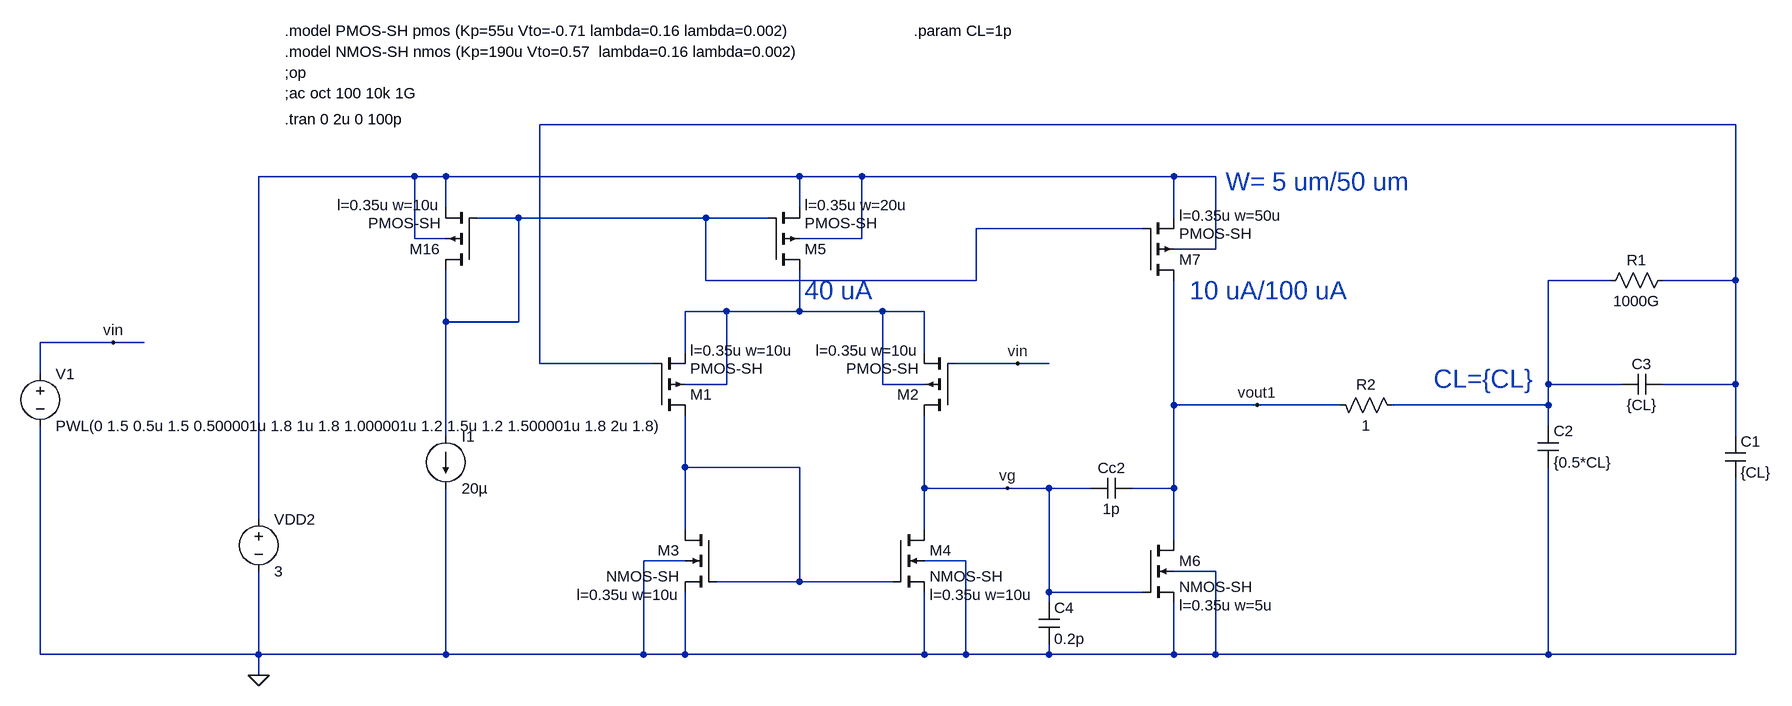
[diagram p0: schematic 5_pmos_opamp_miller-SR.asc]
5_pmos_opamp_miller-SR.asc, the LTspice schematic file:
Version 4
SHEET 1 2008 1124
WIRE 1936 -624 96 -624
WIRE -96 -544 -336 -544
WIRE -48 -544 -96 -544
WIRE 496 -544 -48 -544
WIRE 592 -544 496 -544
WIRE 1072 -544 592 -544
WIRE 1136 -544 1072 -544
WIRE -48 -496 -48 -544
WIRE 496 -496 496 -544
WIRE 64 -480 0 -480
WIRE 352 -480 64 -480
WIRE 448 -480 352 -480
WIRE 1072 -480 1072 -544
WIRE 1024 -464 768 -464
WIRE -96 -448 -96 -544
WIRE -48 -448 -96 -448
WIRE 592 -448 592 -544
WIRE 592 -448 496 -448
WIRE 1136 -432 1136 -544
WIRE 1136 -432 1072 -432
WIRE 352 -384 352 -480
WIRE 768 -384 768 -464
WIRE 768 -384 352 -384
WIRE 1744 -384 1648 -384
WIRE 1936 -384 1936 -624
WIRE 1936 -384 1824 -384
WIRE 384 -336 320 -336
WIRE 496 -336 496 -400
WIRE 496 -336 384 -336
WIRE 624 -336 496 -336
WIRE 688 -336 624 -336
WIRE -48 -320 -48 -400
WIRE 64 -320 64 -480
WIRE 64 -320 -48 -320
WIRE -560 -288 -672 -288
WIRE -512 -288 -560 -288
WIRE 320 -272 320 -336
WIRE 688 -272 688 -336
WIRE 96 -256 96 -624
WIRE 272 -256 96 -256
WIRE 832 -256 736 -256
WIRE 880 -256 832 -256
WIRE -672 -240 -672 -288
WIRE 384 -224 384 -336
WIRE 384 -224 320 -224
WIRE 624 -224 624 -336
WIRE 688 -224 624 -224
WIRE 1648 -224 1648 -384
WIRE 1760 -224 1648 -224
WIRE 1936 -224 1936 -384
WIRE 1936 -224 1824 -224
WIRE 1072 -192 1072 -384
WIRE 1200 -192 1072 -192
WIRE 1328 -192 1200 -192
WIRE 1648 -192 1648 -224
WIRE 1648 -192 1408 -192
WIRE 1648 -160 1648 -192
WIRE -48 -144 -48 -320
WIRE 1936 -144 1936 -224
WIRE 320 -96 320 -176
WIRE 496 -96 320 -96
WIRE 688 -64 688 -176
WIRE 816 -64 688 -64
WIRE 880 -64 816 -64
WIRE 944 -64 880 -64
WIRE 1072 -64 1072 -192
WIRE 1072 -64 1008 -64
WIRE -336 -16 -336 -544
WIRE 320 0 320 -96
WIRE 688 0 688 -64
WIRE 1072 16 1072 -64
WIRE 320 48 256 48
WIRE 752 48 688 48
WIRE 1136 64 1072 64
WIRE 496 80 496 -96
WIRE 496 80 368 80
WIRE 640 80 496 80
WIRE 880 96 880 -64
WIRE 1024 96 880 96
WIRE 880 112 880 96
WIRE -672 192 -672 -160
WIRE -336 192 -336 64
WIRE -336 192 -672 192
WIRE -48 192 -48 -64
WIRE -48 192 -336 192
WIRE 256 192 256 48
WIRE 256 192 -48 192
WIRE 320 192 320 96
WIRE 320 192 256 192
WIRE 688 192 688 96
WIRE 688 192 320 192
WIRE 752 192 752 48
WIRE 752 192 688 192
WIRE 880 192 880 176
WIRE 880 192 752 192
WIRE 1072 192 1072 112
WIRE 1072 192 880 192
WIRE 1136 192 1136 64
WIRE 1136 192 1072 192
WIRE 1648 192 1648 -96
WIRE 1648 192 1136 192
WIRE 1936 192 1936 -80
WIRE 1936 192 1648 192
WIRE -336 224 -336 192
FLAG -336 224 0
FLAG 1200 -192 vout1
FLAG -560 -288 vin
FLAG 832 -256 vin
FLAG 816 -64 vg
SYMBOL pmos4 272 -176 M180
WINDOW 123 56 100 Left 2
SYMATTR Value2 l=0.35u w=10u
SYMATTR InstName M1
SYMATTR Value PMOS-SH
SYMBOL pmos4 736 -176 R180
WINDOW 123 56 100 Left 2
SYMATTR Value2 l=0.35u w=10u
SYMATTR InstName M2
SYMATTR Value PMOS-SH
SYMBOL pmos4 448 -400 M180
WINDOW 123 56 100 Left 2
SYMATTR Value2 l=0.35u w=20u
SYMATTR InstName M5
SYMATTR Value PMOS-SH
SYMBOL nmos4 368 0 M0
WINDOW 123 56 100 Left 2
SYMATTR Value2 l=0.35u w=10u
SYMATTR InstName M3
SYMATTR Value NMOS-SH
SYMBOL nmos4 640 0 R0
WINDOW 123 56 100 Left 2
SYMATTR Value2 l=0.35u w=10u
SYMATTR InstName M4
SYMATTR Value NMOS-SH
SYMBOL nmos4 1024 16 R0
WINDOW 123 56 100 Left 2
SYMATTR Value2 l=0.35u w=5u
SYMATTR InstName M6
SYMATTR Value NMOS-SH
SYMBOL pmos4 1024 -384 M180
WINDOW 123 56 100 Left 2
SYMATTR Value2 l=0.35u w=50u
SYMATTR InstName M7
SYMATTR Value PMOS-SH
SYMBOL pmos4 0 -400 R180
WINDOW 123 56 100 Left 2
SYMATTR Value2 l=0.35u w=10u
SYMATTR InstName M16
SYMATTR Value PMOS-SH
SYMBOL cap 944 -48 R270
WINDOW 0 32 32 VTop 2
WINDOW 3 0 32 VBottom 2
SYMATTR InstName Cc2
SYMATTR Value 1p
SYMBOL voltage -336 -32 R0
WINDOW 123 0 0 Left 2
WINDOW 39 0 0 Left 2
SYMATTR InstName VDD2
SYMATTR Value 3
SYMBOL cap 1920 -144 R0
SYMATTR InstName C1
SYMATTR Value {CL}
SYMBOL cap 1632 -160 R0
SYMATTR InstName C2
SYMATTR Value {0.5*CL}
SYMBOL cap 1824 -240 R90
WINDOW 0 0 32 VBottom 2
WINDOW 3 32 32 VTop 2
SYMATTR InstName C3
SYMATTR Value {CL}
SYMBOL voltage -672 -256 R0
WINDOW 123 0 0 Left 0
WINDOW 39 0 0 Left 0
SYMATTR InstName V1
SYMATTR Value PWL(0 1.5 0.5u 1.5 0.500001u 1.8 1u 1.8 1.000001u 1.2 1.5u 1.2 1.500001u 1.8 2u 1.8)
SYMBOL res 1840 -400 R90
WINDOW 0 0 56 VBottom 2
WINDOW 3 32 56 VTop 2
SYMATTR InstName R1
SYMATTR Value 1000G
SYMBOL current -48 -144 R0
SYMATTR InstName I1
SYMATTR Value 20µ
SYMBOL cap 864 112 R0
SYMATTR InstName C4
SYMATTR Value 0.2p
SYMBOL res 1312 -208 M90
WINDOW 0 0 56 VBottom 2
WINDOW 3 32 56 VTop 2
SYMATTR InstName R2
SYMATTR Value 1
TEXT -296 -736 Left 2 !.model NMOS-SH nmos (Kp=190u Vto=0.57  lambda=0.16 lambda=0.002)
TEXT -296 -704 Left 2 !;op
TEXT -296 -672 Left 2 !;ac oct 100 10k 1G
TEXT -296 -768 Left 2 !.model PMOS-SH pmos (Kp=55u Vto=-0.71 lambda=0.16 lambda=0.002)
TEXT -296 -632 Left 2 !.tran 0 2u 0 100p
TEXT 504 -368 Left 4 ;40 uA
TEXT 1096 -368 Left 4 ;10 uA/100 uA
TEXT 1152 -536 Left 4 ;W= 5 um/50 um
TEXT 1472 -232 Left 4 ;CL={CL}
TEXT 672 -768 Left 2 !.param CL=1p

The netlist it stands for:
* 5_pmos_opamp_miller-SR.asc
M1 N006 N001 N005 N005 PMOS-SH l=0.35u w=10u
M2 vg vin N005 N005 PMOS-SH l=0.35u w=10u
M5 N005 N003 N002 N002 PMOS-SH l=0.35u w=20u
M3 N006 N006 0 0 NMOS-SH l=0.35u w=10u
M4 vg N006 0 0 NMOS-SH l=0.35u w=10u
M6 vout1 vg 0 0 NMOS-SH l=0.35u w=5u
M7 vout1 N003 N002 N002 PMOS-SH l=0.35u w=50u
M16 N003 N003 N002 N002 PMOS-SH l=0.35u w=10u
Cc2 vg vout1 1p
VDD2 N002 0 3
C1 N001 0 {CL}
C2 N004 0 {0.5*CL}
C3 N001 N004 {CL}
V1 vin 0 PWL(0 1.5 0.5u 1.5 0.500001u 1.8 1u 1.8 1.000001u 1.2 1.5u 1.2 1.500001u 1.8 2u 1.8)
R1 N001 N004 1000G
I1 N003 0 20µ
C4 vg 0 0.2p
R2 vout1 N004 1
.model NMOS NMOS
.model PMOS PMOS
.lib standard.mos
.model NMOS-SH nmos (Kp=190u Vto=0.57  lambda=0.16 lambda=0.002)
;op
;ac oct 100 10k 1G
.model PMOS-SH pmos (Kp=55u Vto=-0.71 lambda=0.16 lambda=0.002)
.tran 0 2u 0 100p
* 40 uA
* 10 uA/100 uA
* W= 5 um/50 um
* CL={CL}
.param CL=1p
.backanno
.end